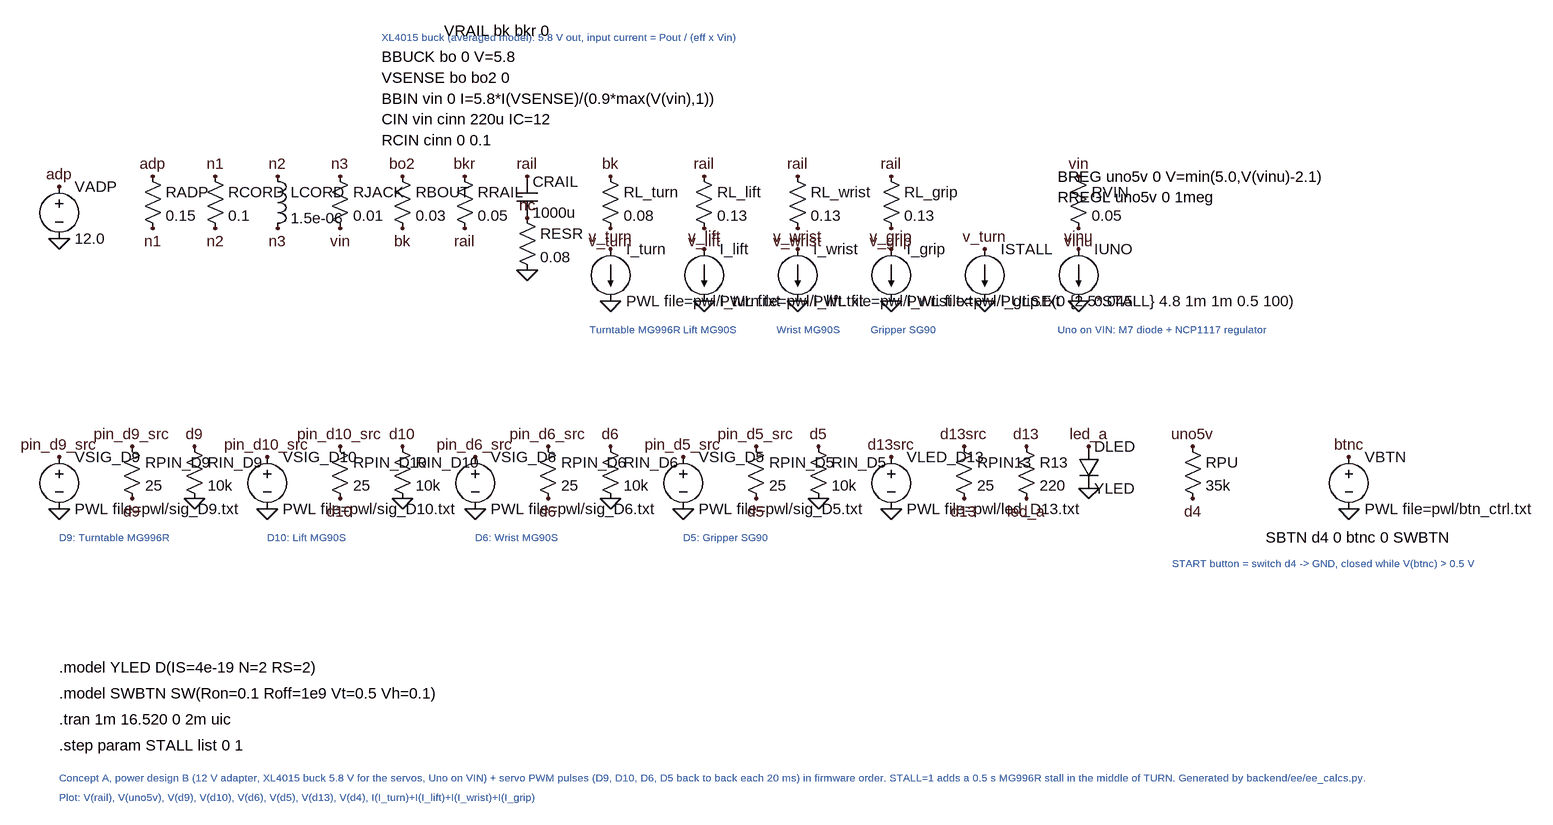
[diagram p0: schematic concept_a.asc]
concept_a.asc, the LTspice schematic file:
Version 4
SHEET 1 2600 1400
SYMBOL voltage 64 64 R0
SYMATTR InstName VADP
SYMATTR Value 12.0
FLAG 64 80 adp
FLAG 64 160 0
SYMBOL res 192 48 R0
SYMATTR InstName RADP
SYMATTR Value 0.15
FLAG 208 64 adp
FLAG 208 144 n1
SYMBOL res 288 48 R0
SYMATTR InstName RCORD
SYMATTR Value 0.1
FLAG 304 64 n1
FLAG 304 144 n2
SYMBOL ind 384 48 R0
SYMATTR InstName LCORD
SYMATTR Value 1.5e-06
FLAG 400 64 n2
FLAG 400 144 n3
SYMBOL res 480 48 R0
SYMATTR InstName RJACK
SYMATTR Value 0.01
FLAG 496 64 n3
FLAG 496 144 vin
TEXT 560 -120 Left 2 !BBUCK bo 0 V=5.8
TEXT 560 -88 Left 2 !VSENSE bo bo2 0
TEXT 560 -56 Left 2 !BBIN vin 0 I=5.8*I(VSENSE)/(0.9*max(V(vin),1))
TEXT 560 -150 Left 1 ;XL4015 buck (averaged model): 5.8 V out, input current = Pout / (eff x Vin)
TEXT 560 -24 Left 2 !CIN vin cinn 220u IC=12
TEXT 560 8 Left 2 !RCIN cinn 0 0.1
SYMBOL res 576 48 R0
SYMATTR InstName RBOUT
SYMATTR Value 0.03
FLAG 592 64 bo2
FLAG 592 144 bk
TEXT 656 -160 Left 2 !VRAIL bk bkr 0
SYMBOL res 672 48 R0
SYMATTR InstName RRAIL
SYMATTR Value 0.05
FLAG 688 64 bkr
FLAG 688 144 rail
SYMBOL cap 768 64 R0
SYMATTR InstName CRAIL
SYMATTR Value 1000u
FLAG 784 64 rail
FLAG 784 128 nc
SYMBOL res 768 112 R0
SYMATTR InstName RESR
SYMATTR Value 0.08
FLAG 784 128 nc
FLAG 784 208 0
SYMBOL res 896 48 R0
SYMATTR InstName RL_turn
SYMATTR Value 0.08
FLAG 912 64 bk
FLAG 912 144 v_turn
SYMBOL current 912 176 R0
SYMATTR InstName I_turn
SYMATTR Value PWL file=pwl/i_turn.txt
FLAG 912 176 v_turn
FLAG 912 256 0
TEXT 880 300 Left 1 ;Turntable MG996R
SYMBOL res 1040 48 R0
SYMATTR InstName RL_lift
SYMATTR Value 0.13
FLAG 1056 64 rail
FLAG 1056 144 v_lift
SYMBOL current 1056 176 R0
SYMATTR InstName I_lift
SYMATTR Value PWL file=pwl/i_lift.txt
FLAG 1056 176 v_lift
FLAG 1056 256 0
TEXT 1024 300 Left 1 ;Lift MG90S
SYMBOL res 1184 48 R0
SYMATTR InstName RL_wrist
SYMATTR Value 0.13
FLAG 1200 64 rail
FLAG 1200 144 v_wrist
SYMBOL current 1200 176 R0
SYMATTR InstName I_wrist
SYMATTR Value PWL file=pwl/i_wrist.txt
FLAG 1200 176 v_wrist
FLAG 1200 256 0
TEXT 1168 300 Left 1 ;Wrist MG90S
SYMBOL res 1328 48 R0
SYMATTR InstName RL_grip
SYMATTR Value 0.13
FLAG 1344 64 rail
FLAG 1344 144 v_grip
SYMBOL current 1344 176 R0
SYMATTR InstName I_grip
SYMATTR Value PWL file=pwl/i_grip.txt
FLAG 1344 176 v_grip
FLAG 1344 256 0
TEXT 1312 300 Left 1 ;Gripper SG90
SYMBOL current 1488 176 R0
SYMATTR InstName ISTALL
SYMATTR Value PULSE(0 {2.5*STALL} 4.8 1m 1m 0.5 100)
FLAG 1488 176 v_turn
FLAG 1488 256 0
SYMBOL res 1616 48 R0
SYMATTR InstName RVIN
SYMATTR Value 0.05
FLAG 1632 64 vin
FLAG 1632 144 vinu
SYMBOL current 1632 176 R0
SYMATTR InstName IUNO
SYMATTR Value 0.045
FLAG 1632 176 vinu
FLAG 1632 256 0
TEXT 1600 64 Left 2 !BREG uno5v 0 V=min(5.0,V(vinu)-2.1)
TEXT 1600 96 Left 2 !RREGL uno5v 0 1meg
TEXT 1600 300 Left 1 ;Uno on VIN: M7 diode + NCP1117 regulator
SYMBOL voltage 64 480 R0
SYMATTR InstName VSIG_D9
SYMATTR Value PWL file=pwl/sig_D9.txt
FLAG 64 496 pin_d9_src
FLAG 64 576 0
SYMBOL res 160 464 R0
SYMATTR InstName RPIN_D9
SYMATTR Value 25
FLAG 176 480 pin_d9_src
FLAG 176 560 d9
SYMBOL res 256 464 R0
SYMATTR InstName RIN_D9
SYMATTR Value 10k
FLAG 272 480 d9
FLAG 272 560 0
TEXT 64 620 Left 1 ;D9: Turntable MG996R
SYMBOL voltage 384 480 R0
SYMATTR InstName VSIG_D10
SYMATTR Value PWL file=pwl/sig_D10.txt
FLAG 384 496 pin_d10_src
FLAG 384 576 0
SYMBOL res 480 464 R0
SYMATTR InstName RPIN_D10
SYMATTR Value 25
FLAG 496 480 pin_d10_src
FLAG 496 560 d10
SYMBOL res 576 464 R0
SYMATTR InstName RIN_D10
SYMATTR Value 10k
FLAG 592 480 d10
FLAG 592 560 0
TEXT 384 620 Left 1 ;D10: Lift MG90S
SYMBOL voltage 704 480 R0
SYMATTR InstName VSIG_D6
SYMATTR Value PWL file=pwl/sig_D6.txt
FLAG 704 496 pin_d6_src
FLAG 704 576 0
SYMBOL res 800 464 R0
SYMATTR InstName RPIN_D6
SYMATTR Value 25
FLAG 816 480 pin_d6_src
FLAG 816 560 d6
SYMBOL res 896 464 R0
SYMATTR InstName RIN_D6
SYMATTR Value 10k
FLAG 912 480 d6
FLAG 912 560 0
TEXT 704 620 Left 1 ;D6: Wrist MG90S
SYMBOL voltage 1024 480 R0
SYMATTR InstName VSIG_D5
SYMATTR Value PWL file=pwl/sig_D5.txt
FLAG 1024 496 pin_d5_src
FLAG 1024 576 0
SYMBOL res 1120 464 R0
SYMATTR InstName RPIN_D5
SYMATTR Value 25
FLAG 1136 480 pin_d5_src
FLAG 1136 560 d5
SYMBOL res 1216 464 R0
SYMATTR InstName RIN_D5
SYMATTR Value 10k
FLAG 1232 480 d5
FLAG 1232 560 0
TEXT 1024 620 Left 1 ;D5: Gripper SG90
SYMBOL voltage 1344 480 R0
SYMATTR InstName VLED_D13
SYMATTR Value PWL file=pwl/led_D13.txt
FLAG 1344 496 d13src
FLAG 1344 576 0
SYMBOL res 1440 464 R0
SYMATTR InstName RPIN13
SYMATTR Value 25
FLAG 1456 480 d13src
FLAG 1456 560 d13
SYMBOL res 1536 464 R0
SYMATTR InstName R13
SYMATTR Value 220
FLAG 1552 480 d13
FLAG 1552 560 led_a
SYMBOL diode 1632 480 R0
SYMATTR InstName DLED
SYMATTR Value YLED
FLAG 1648 480 led_a
FLAG 1648 544 0
SYMBOL res 1792 464 R0
SYMATTR InstName RPU
SYMATTR Value 35k
FLAG 1808 480 uno5v
FLAG 1808 560 d4
TEXT 1920 620 Left 2 !SBTN d4 0 btnc 0 SWBTN
TEXT 1776 660 Left 1 ;START button = switch d4 -> GND, closed while V(btnc) > 0.5 V
SYMBOL voltage 2048 480 R0
SYMATTR InstName VBTN
SYMATTR Value PWL file=pwl/btn_ctrl.txt
FLAG 2048 496 btnc
FLAG 2048 576 0
TEXT 64 820 Left 2 !.model YLED D(IS=4e-19 N=2 RS=2)
TEXT 64 860 Left 2 !.model SWBTN SW(Ron=0.1 Roff=1e9 Vt=0.5 Vh=0.1)
TEXT 64 900 Left 2 !.tran 1m 16.520 0 2m uic
TEXT 64 940 Left 2 !.step param STALL list 0 1
TEXT 64 990 Left 1 ;Concept A, power design B (12 V adapter, XL4015 buck 5.8 V for the servos, Uno on VIN) + servo PWM pulses (D9, D10, D6, D5 back to back each 20 ms) in firmware order. STALL=1 adds a 0.5 s MG996R stall in the middle of TURN. Generated by backend/ee/ee_calcs.py.
TEXT 64 1020 Left 1 ;Plot: V(rail), V(uno5v), V(d9), V(d10), V(d6), V(d5), V(d13), V(d4), I(I_turn)+I(I_lift)+I(I_wrist)+I(I_grip)

The netlist it stands for:
* concept_a.asc
VADP adp 0 12.0
RADP adp n1 0.15
RCORD n1 n2 0.1
LCORD n2 n3 1.5e-06
RJACK n3 vin 0.01
RBOUT bo2 bk 0.03
RRAIL bkr rail 0.05
CRAIL rail nc 1000u
RESR nc 0 0.08
RL_turn bk v_turn 0.08
I_turn v_turn 0 PWL file=pwl/i_turn.txt
RL_lift rail v_lift 0.13
I_lift v_lift 0 PWL file=pwl/i_lift.txt
RL_wrist rail v_wrist 0.13
I_wrist v_wrist 0 PWL file=pwl/i_wrist.txt
RL_grip rail v_grip 0.13
I_grip v_grip 0 PWL file=pwl/i_grip.txt
ISTALL v_turn 0 PULSE(0 {2.5*STALL} 4.8 1m 1m 0.5 100)
RVIN vin vinu 0.05
IUNO vinu 0 0.045
VSIG_D9 pin_d9_src 0 PWL file=pwl/sig_D9.txt
RPIN_D9 pin_d9_src d9 25
RIN_D9 d9 0 10k
VSIG_D10 pin_d10_src 0 PWL file=pwl/sig_D10.txt
RPIN_D10 pin_d10_src d10 25
RIN_D10 d10 0 10k
VSIG_D6 pin_d6_src 0 PWL file=pwl/sig_D6.txt
RPIN_D6 pin_d6_src d6 25
RIN_D6 d6 0 10k
VSIG_D5 pin_d5_src 0 PWL file=pwl/sig_D5.txt
RPIN_D5 pin_d5_src d5 25
RIN_D5 d5 0 10k
VLED_D13 d13src 0 PWL file=pwl/led_D13.txt
RPIN13 d13src d13 25
R13 d13 led_a 220
DLED led_a 0 YLED
RPU uno5v d4 35k
VBTN btnc 0 PWL file=pwl/btn_ctrl.txt
.model D D
.lib standard.dio
BBUCK bo 0 V=5.8
VSENSE bo bo2 0
BBIN vin 0 I=5.8*I(VSENSE)/(0.9*max(V(vin),1))
* XL4015 buck (averaged model): 5.8 V out, input current = Pout / (eff x Vin)
CIN vin cinn 220u IC=12
RCIN cinn 0 0.1
VRAIL bk bkr 0
* Turntable MG996R
* Lift MG90S
* Wrist MG90S
* Gripper SG90
BREG uno5v 0 V=min(5.0,V(vinu)-2.1)
RREGL uno5v 0 1meg
* Uno on VIN: M7 diode + NCP1117 regulator
* D9: Turntable MG996R
* D10: Lift MG90S
* D6: Wrist MG90S
* D5: Gripper SG90
SBTN d4 0 btnc 0 SWBTN
* START button = switch d4 -> GND, closed while V(btnc) > 0.5 V
.model YLED D(IS=4e-19 N=2 RS=2)
.model SWBTN SW(Ron=0.1 Roff=1e9 Vt=0.5 Vh=0.1)
.tran 1m 16.520 0 2m uic
.step param STALL list 0 1
* Concept A, power design B (12 V adapter, XL4015 buck 5.8 V for the servos, Uno on VIN) + servo PWM pulses (D9, D10, D6, D5 back to back each 20 ms) in firmware order. STALL=1 adds a 0.5 s MG996R stall in the middle of TURN. Generated by backend/ee/ee_calcs.py.
* Plot: V(rail), V(uno5v), V(d9), V(d10), V(d6), V(d5), V(d13), V(d4), I(I_turn)+I(I_lift)+I(I_wrist)+I(I_grip)
.backanno
.end